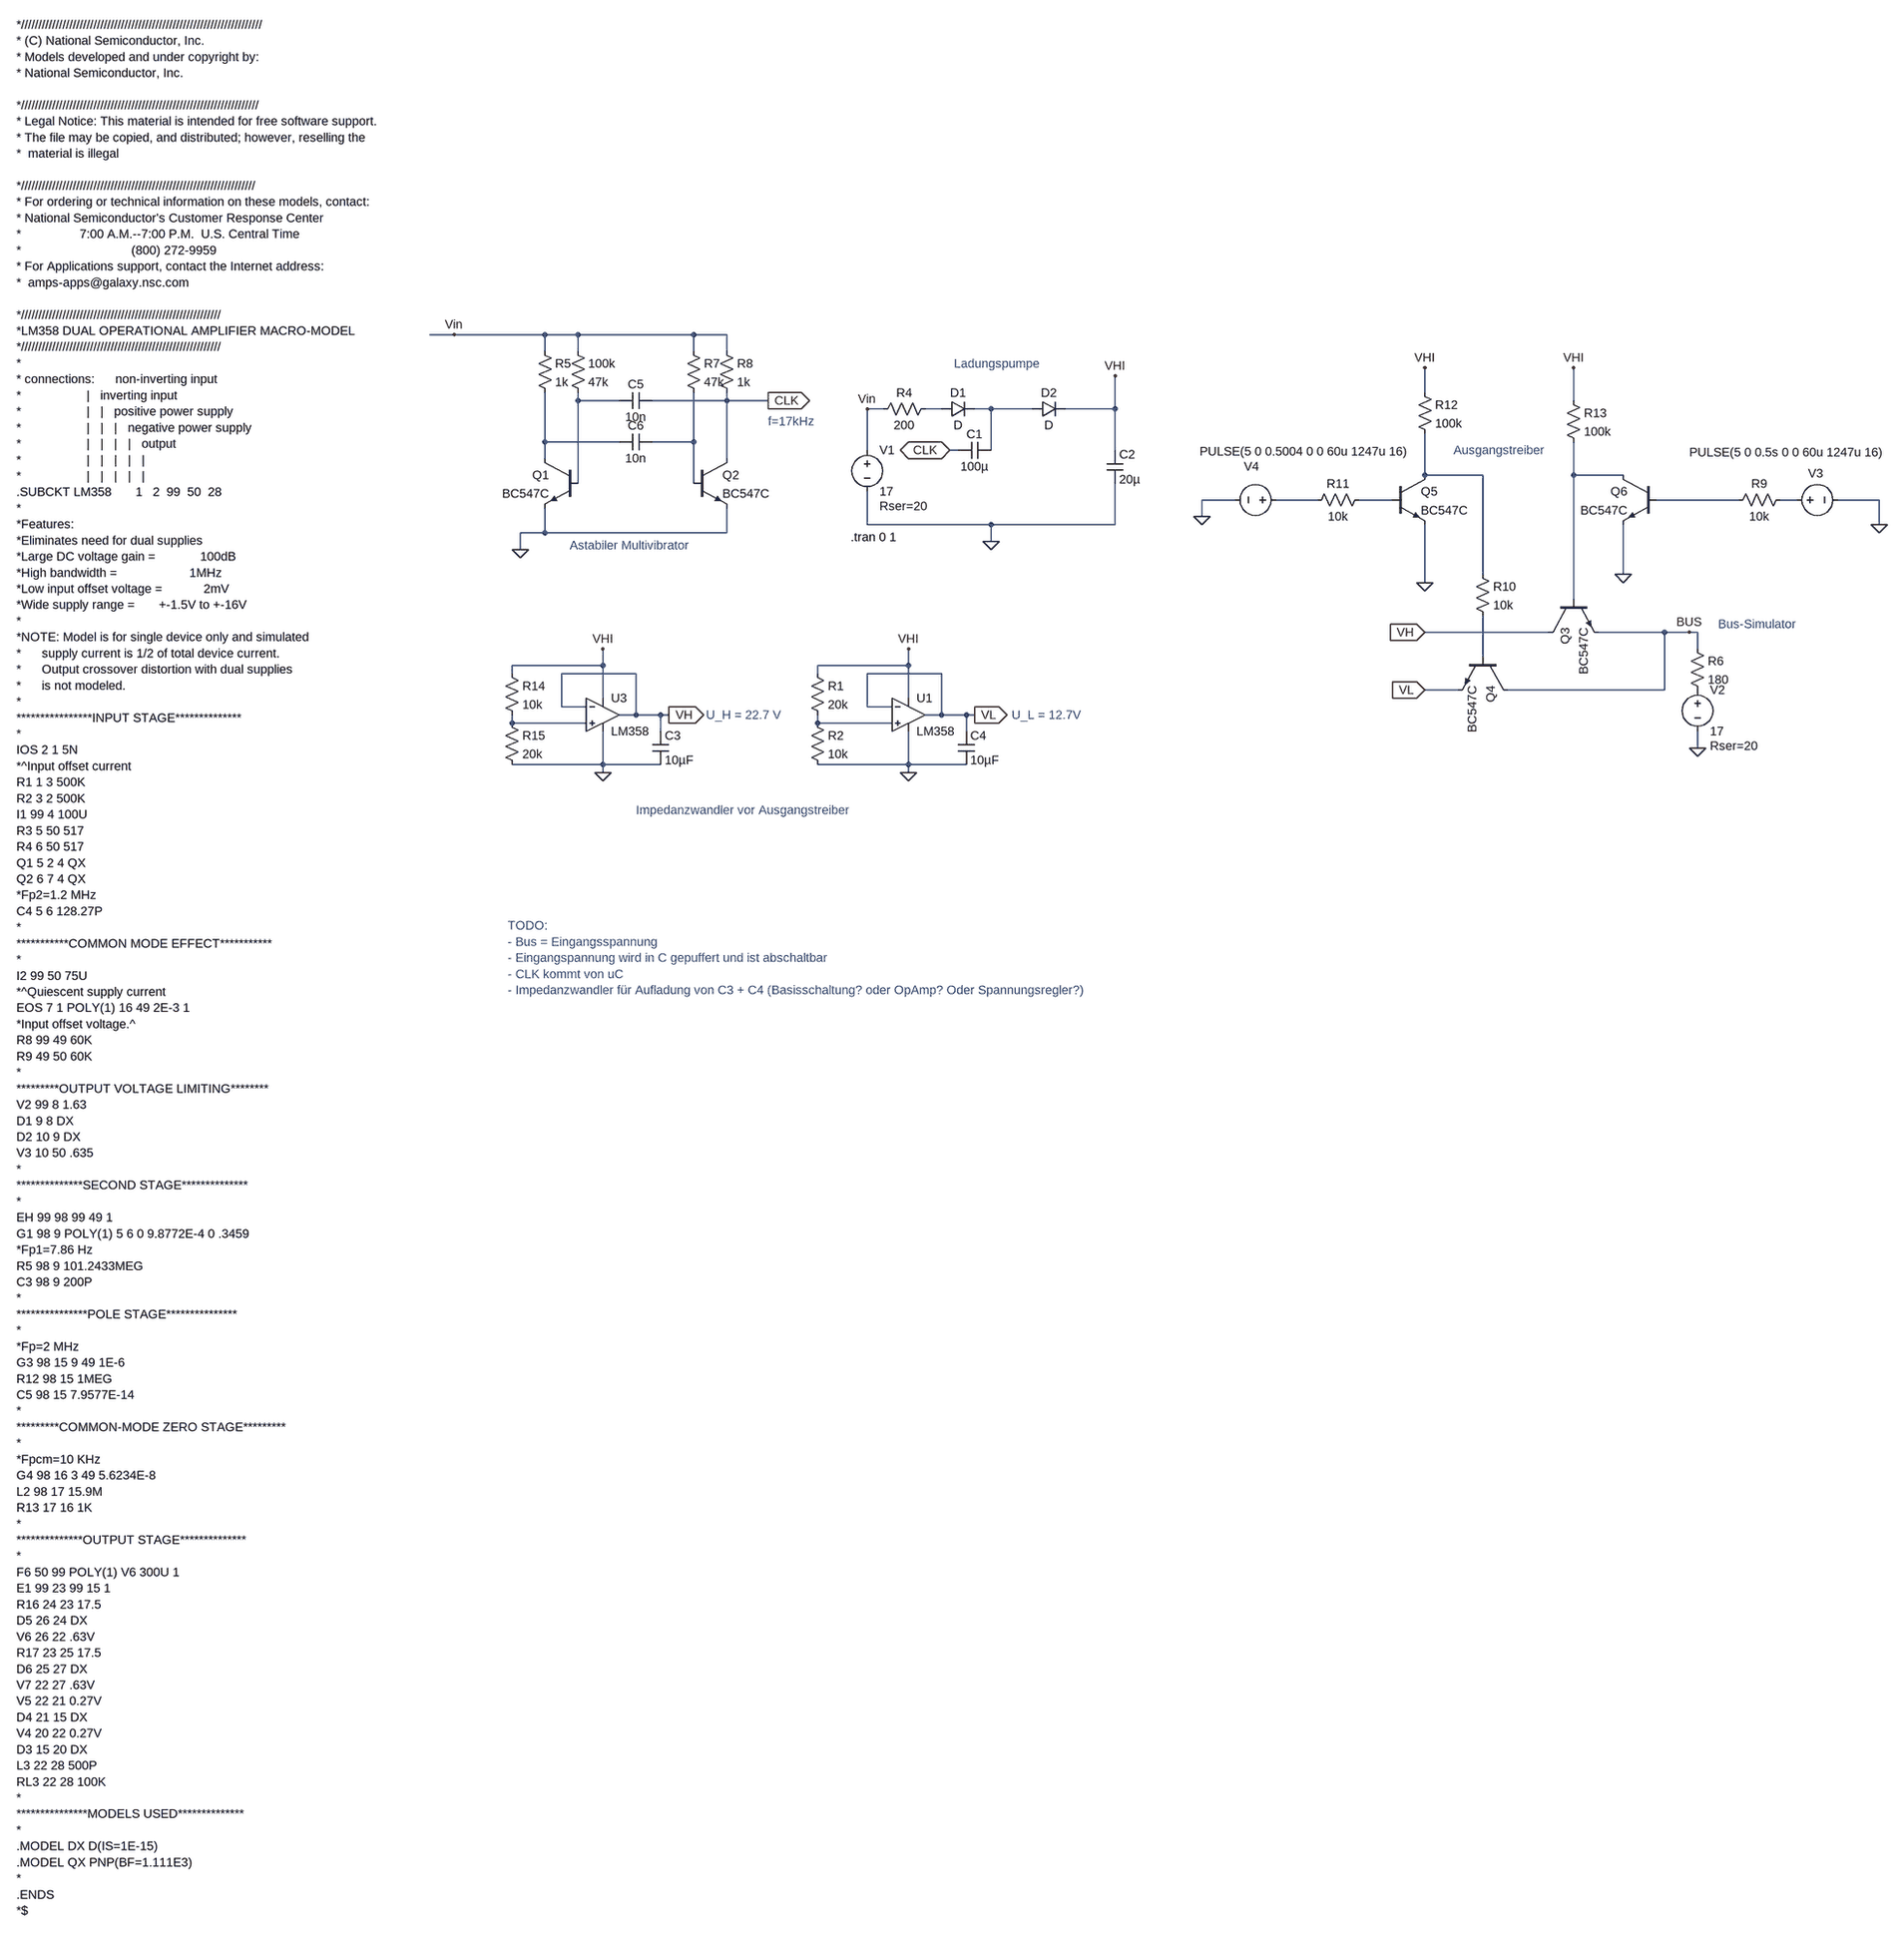
[diagram p0: schematic DriverC1.asc]
DriverC1.asc, the LTspice schematic file:
Version 4
SHEET 1 2516 2612
WIRE -768 -80 -816 -80
WIRE -592 -80 -768 -80
WIRE -528 -80 -592 -80
WIRE -304 -80 -528 -80
WIRE -240 -80 -304 -80
WIRE -592 -48 -592 -80
WIRE -528 -48 -528 -80
WIRE -304 -48 -304 -80
WIRE -240 -48 -240 -80
WIRE 1232 32 1232 -16
WIRE -528 48 -528 32
WIRE -448 48 -528 48
WIRE -240 48 -240 32
WIRE -240 48 -384 48
WIRE -160 48 -240 48
WIRE 1520 48 1520 -16
WIRE 64 64 32 64
WIRE 176 64 144 64
WIRE 272 64 240 64
WIRE 352 64 272 64
WIRE 512 64 512 0
WIRE 512 64 416 64
WIRE -592 128 -592 32
WIRE -448 128 -592 128
WIRE -304 128 -304 32
WIRE -304 128 -384 128
WIRE 32 144 32 64
WIRE 208 144 192 144
WIRE 272 144 272 64
WIRE 512 144 512 64
WIRE -592 160 -592 128
WIRE -240 160 -240 48
WIRE 1232 192 1232 112
WIRE 1344 192 1232 192
WIRE 1520 192 1520 128
WIRE 1616 192 1520 192
WIRE -528 208 -528 48
WIRE -304 208 -304 128
WIRE 864 240 800 240
WIRE 1024 240 944 240
WIRE 1168 240 1104 240
WIRE 1840 240 1680 240
WIRE 1952 240 1920 240
WIRE 2112 240 2032 240
WIRE 800 272 800 240
WIRE 32 288 32 224
WIRE 272 288 32 288
WIRE 512 288 512 208
WIRE 512 288 272 288
WIRE 2112 288 2112 240
WIRE -592 304 -592 256
WIRE -592 304 -640 304
WIRE -240 304 -240 256
WIRE -240 304 -592 304
WIRE 272 320 272 288
WIRE -640 336 -640 304
WIRE 1344 384 1344 192
WIRE 1616 384 1616 288
WIRE 1232 400 1232 288
WIRE 1520 432 1520 192
WIRE 1472 496 1232 496
WIRE 1696 496 1568 496
WIRE 1744 496 1696 496
WIRE 1760 496 1744 496
WIRE 1760 528 1760 496
WIRE 1344 544 1344 464
WIRE -480 560 -480 528
WIRE -480 560 -656 560
WIRE 112 560 112 528
WIRE 112 560 -64 560
WIRE -656 576 -656 560
WIRE -416 576 -560 576
WIRE -64 576 -64 560
WIRE 176 576 32 576
WIRE 1296 608 1232 608
WIRE 1696 608 1696 496
WIRE 1696 608 1392 608
WIRE -480 624 -480 560
WIRE 112 624 112 560
WIRE -560 640 -560 576
WIRE -512 640 -560 640
WIRE 32 640 32 576
WIRE 80 640 32 640
WIRE -416 656 -416 576
WIRE -416 656 -448 656
WIRE -368 656 -416 656
WIRE -352 656 -368 656
WIRE 176 656 176 576
WIRE 176 656 144 656
WIRE 224 656 176 656
WIRE 240 656 224 656
WIRE -656 672 -656 656
WIRE -512 672 -656 672
WIRE -64 672 -64 656
WIRE 80 672 -64 672
WIRE -368 688 -368 656
WIRE 224 688 224 656
WIRE 1760 720 1760 688
WIRE -480 752 -480 688
WIRE -480 752 -656 752
WIRE -368 752 -480 752
WIRE 112 752 112 688
WIRE 112 752 -64 752
WIRE 224 752 112 752
WIRE -480 768 -480 752
WIRE 112 768 112 752
FLAG 272 320 0
FLAG 192 144 CLK
IOPIN 192 144 BiDir
FLAG -640 336 0
FLAG -768 -80 Vin
FLAG 32 64 Vin
FLAG -160 48 CLK
IOPIN -160 48 Out
FLAG 512 0 VHI
FLAG 1760 720 0
FLAG 2112 288 0
FLAG 1744 496 BUS
FLAG 1232 608 VL
IOPIN 1232 608 In
FLAG 1232 496 VH
IOPIN 1232 496 In
FLAG 1232 -16 VHI
FLAG 800 272 0
FLAG 1232 400 0
FLAG 1520 -16 VHI
FLAG 1616 384 0
FLAG -352 656 VH
IOPIN -352 656 Out
FLAG -480 528 VHI
FLAG -480 768 0
FLAG 240 656 VL
IOPIN 240 656 Out
FLAG 112 528 VHI
FLAG 112 768 0
SYMBOL voltage 32 128 R0
WINDOW 123 0 0 Left 0
WINDOW 39 24 124 Left 2
SYMATTR SpiceLine Rser=20
SYMATTR InstName V1
SYMATTR Value 17
SYMBOL diode 176 80 R270
WINDOW 0 32 32 VTop 2
WINDOW 3 0 32 VBottom 2
SYMATTR InstName D1
SYMBOL diode 352 80 R270
WINDOW 0 32 32 VTop 2
WINDOW 3 0 32 VBottom 2
SYMATTR InstName D2
SYMBOL cap 272 128 R90
WINDOW 0 0 32 VBottom 2
WINDOW 3 32 32 VTop 2
SYMATTR InstName C1
SYMATTR Value 100µ
SYMBOL cap 496 144 R0
SYMATTR InstName C2
SYMATTR Value 20µ
SYMBOL res 160 48 R90
WINDOW 0 0 56 VBottom 2
WINDOW 3 32 56 VTop 2
SYMATTR InstName R4
SYMATTR Value 200
SYMBOL res -608 -64 R0
SYMATTR InstName R5
SYMATTR Value 1k
SYMBOL res -256 -64 R0
SYMATTR InstName R8
SYMATTR Value 1k
SYMBOL npn -528 160 M0
SYMATTR InstName Q1
SYMATTR Value BC547C
SYMBOL npn -304 160 R0
SYMATTR InstName Q2
SYMATTR Value BC547C
SYMBOL res -544 -64 R0
SYMATTR InstName 100k
SYMATTR Value 47k
SYMBOL res -320 -64 R0
SYMATTR InstName R7
SYMATTR Value 47k
SYMBOL cap -384 32 R90
WINDOW 0 0 32 VBottom 2
WINDOW 3 32 32 VTop 2
SYMATTR InstName C5
SYMATTR Value 10n
SYMBOL cap -384 112 R90
WINDOW 0 0 32 VBottom 2
WINDOW 3 32 32 VTop 2
SYMATTR InstName C6
SYMATTR Value 10n
SYMBOL voltage 1760 592 R0
WINDOW 123 0 0 Left 0
WINDOW 39 24 124 Left 2
SYMATTR SpiceLine Rser=20
SYMATTR InstName V2
SYMATTR Value 17
SYMBOL res 1744 512 R0
SYMATTR InstName R6
SYMATTR Value 180
SYMBOL voltage 1936 240 M90
WINDOW 0 -51 68 VLeft 2
WINDOW 3 -92 185 VLeft 2
WINDOW 123 0 0 Left 0
WINDOW 39 0 0 Left 0
SYMATTR InstName V3
SYMATTR Value PULSE(5 0 0.5s 0 0 60u 1247u 16)
SYMBOL npn 1472 432 M90
SYMATTR InstName Q3
SYMATTR Value BC547C
SYMBOL res 1936 224 R90
WINDOW 0 0 56 VBottom 2
WINDOW 3 32 56 VTop 2
SYMATTR InstName R9
SYMATTR Value 10k
SYMBOL voltage 960 240 M270
WINDOW 0 65 78 VLeft 2
WINDOW 3 94 164 VLeft 2
WINDOW 123 0 0 Left 0
WINDOW 39 0 0 Left 0
SYMATTR InstName V4
SYMATTR Value PULSE(5 0 0.5004 0 0 60u 1247u 16)
SYMBOL res 1328 368 R0
SYMATTR InstName R10
SYMATTR Value 10k
SYMBOL npn 1392 544 R90
SYMATTR InstName Q4
SYMATTR Value BC547C
SYMBOL npn 1168 192 R0
SYMATTR InstName Q5
SYMATTR Value BC547C
SYMBOL res 1120 224 R90
WINDOW 0 0 56 VBottom 2
WINDOW 3 32 56 VTop 2
SYMATTR InstName R11
SYMATTR Value 10k
SYMBOL res 1216 16 R0
SYMATTR InstName R12
SYMATTR Value 100k
SYMBOL npn 1680 192 M0
SYMATTR InstName Q6
SYMATTR Value BC547C
SYMBOL res 1504 32 R0
SYMATTR InstName R13
SYMATTR Value 100k
SYMBOL Opamps\\opamp2 -480 592 R0
SYMATTR InstName U3
SYMATTR Value LM358
SYMATTR SpiceModel LM358
SYMBOL res -672 560 R0
SYMATTR InstName R14
SYMATTR Value 10k
SYMBOL res -672 656 R0
SYMATTR InstName R15
SYMATTR Value 20k
SYMBOL cap -384 688 R0
SYMATTR InstName C3
SYMATTR Value 10µF
SYMBOL Opamps\\opamp2 112 592 R0
SYMATTR InstName U1
SYMATTR Value LM358
SYMATTR SpiceModel LM358
SYMBOL res -80 560 R0
SYMATTR InstName R1
SYMATTR Value 20k
SYMBOL res -80 656 R0
SYMATTR InstName R2
SYMATTR Value 10k
SYMBOL cap 208 688 R0
SYMATTR InstName C4
SYMATTR Value 10µF
TEXT 0 312 Left 2 !.tran 0 1
TEXT -544 328 Left 2 ;Astabiler Multivibrator
TEXT 200 -24 Left 2 ;Ladungspumpe
TEXT -160 88 Left 2 ;f=17kHz
TEXT 1800 480 Left 2 ;Bus-Simulator
TEXT 1288 144 Left 2 ;Ausgangstreiber
TEXT -664 1064 Left 2 ;TODO: \n- Bus = Eingangsspannung\n- Eingangspannung wird in C gepuffert und ist abschaltbar\n- CLK kommt von uC\n- Impedanzwandler für Aufladung von C3 + C4 (Basisschaltung? oder OpAmp? Oder Spannungsregler?)
TEXT -2704 -680 Left 2 !*//////////////////////////////////////////////////////////////////////\n* (C) National Semiconductor, Inc.\n* Models developed and under copyright by:\n* National Semiconductor, Inc.  \n \n*/////////////////////////////////////////////////////////////////////\n* Legal Notice: This material is intended for free software support.\n* The file may be copied, and distributed; however, reselling the \n*  material is illegal\n \n*////////////////////////////////////////////////////////////////////\n* For ordering or technical information on these models, contact:\n* National Semiconductor's Customer Response Center\n*                 7:00 A.M.--7:00 P.M.  U.S. Central Time\n*                                (800) 272-9959\n* For Applications support, contact the Internet address:\n*  amps-apps@galaxy.nsc.com\n \n*//////////////////////////////////////////////////////////\n*LM358 DUAL OPERATIONAL AMPLIFIER MACRO-MODEL\n*//////////////////////////////////////////////////////////\n*\n* connections:      non-inverting input\n*                   |   inverting input\n*                   |   |   positive power supply\n*                   |   |   |   negative power supply\n*                   |   |   |   |   output\n*                   |   |   |   |   |\n*                   |   |   |   |   |\n.SUBCKT LM358       1   2  99  50  28\n*\n*Features:\n*Eliminates need for dual supplies\n*Large DC voltage gain =             100dB\n*High bandwidth =                     1MHz\n*Low input offset voltage =            2mV\n*Wide supply range =       +-1.5V to +-16V\n*\n*NOTE: Model is for single device only and simulated\n*      supply current is 1/2 of total device current.\n*      Output crossover distortion with dual supplies\n*      is not modeled.\n*\n****************INPUT STAGE**************\n*\nIOS 2 1 5N\n*^Input offset current\nR1 1 3 500K\nR2 3 2 500K\nI1 99 4 100U\nR3 5 50 517\nR4 6 50 517\nQ1 5 2 4 QX\nQ2 6 7 4 QX\n*Fp2=1.2 MHz\nC4 5 6 128.27P\n*\n***********COMMON MODE EFFECT***********\n*\nI2 99 50 75U\n*^Quiescent supply current\nEOS 7 1 POLY(1) 16 49 2E-3 1\n*Input offset voltage.^\nR8 99 49 60K\nR9 49 50 60K\n*\n*********OUTPUT VOLTAGE LIMITING********\nV2 99 8 1.63\nD1 9 8 DX\nD2 10 9 DX\nV3 10 50 .635\n*\n**************SECOND STAGE**************\n*\nEH 99 98 99 49 1\nG1 98 9 POLY(1) 5 6 0 9.8772E-4 0 .3459\n*Fp1=7.86 Hz\nR5 98 9 101.2433MEG\nC3 98 9 200P\n*\n***************POLE STAGE***************\n*\n*Fp=2 MHz\nG3 98 15 9 49 1E-6\nR12 98 15 1MEG\nC5 98 15 7.9577E-14\n*\n*********COMMON-MODE ZERO STAGE*********\n*\n*Fpcm=10 KHz\nG4 98 16 3 49 5.6234E-8               \nL2 98 17 15.9M\nR13 17 16 1K\n*\n**************OUTPUT STAGE**************\n*\nF6 50 99 POLY(1) V6 300U 1\nE1 99 23 99 15 1\nR16 24 23 17.5\nD5 26 24 DX\nV6 26 22 .63V\nR17 23 25 17.5\nD6 25 27 DX\nV7 22 27 .63V\nV5 22 21 0.27V\nD4 21 15 DX\nV4 20 22 0.27V\nD3 15 20 DX\nL3 22 28 500P\nRL3 22 28 100K\n*\n***************MODELS USED**************\n*\n.MODEL DX D(IS=1E-15)\n.MODEL QX PNP(BF=1.111E3)\n*\n.ENDS\n*$
TEXT -280 656 Left 2 ;U_H = 22.7 V
TEXT 312 656 Left 2 ;U_L = 12.7V
TEXT -416 840 Left 2 ;Impedanzwandler vor Ausgangstreiber

The netlist it stands for:
* DriverC1.asc
V1 Vin 0 17 Rser=20
D1 N002 N003 D
D2 N003 VHI D
C1 N003 CLK 100µ
C2 VHI 0 20µ
R4 N002 Vin 200
R5 Vin N004 1k
R8 Vin CLK 1k
Q1 N004 N001 0 0 BC547C
Q2 CLK N005 0 0 BC547C
R§100k Vin N001 47k
R7 Vin N005 47k
C5 CLK N001 10n
C6 N005 N004 10n
V2 P001 0 17 Rser=20
R6 BUS P001 180
V3 N011 0 PULSE(5 0 0.5s 0 0 60u 1247u 16)
Q3 VH N007 BUS 0 BC547C
R9 N011 N010 10k
V4 N008 0 PULSE(5 0 0.5004 0 0 60u 1247u 16)
R10 N006 N012 10k
Q4 BUS N012 VL 0 BC547C
Q5 N006 N009 0 0 BC547C
R11 N009 N008 10k
R12 VHI N006 100k
Q6 N007 N010 0 0 BC547C
R13 VHI N007 100k
XU3 N013 VH VHI 0 VH LM358 LM358  ; pins In+ In- V+ V- OUT
R14 VHI N013 10k
R15 N013 0 20k
C3 VH 0 10µF
XU1 N014 VL VHI 0 VL LM358 LM358  ; pins In+ In- V+ V- OUT
R1 VHI N014 20k
R2 N014 0 10k
C4 VL 0 10µF
.model D D
.lib standard.dio
.model NPN NPN
.model PNP PNP
.lib standard.bjt
.tran 0 1
* Astabiler Multivibrator
* Ladungspumpe
* f=17kHz
* Bus-Simulator
* Ausgangstreiber
* TODO:
* - Bus = Eingangsspannung
* - Eingangspannung wird in C gepuffert und ist abschaltbar
* - CLK kommt von uC
* - Impedanzwandler für Aufladung von C3 + C4 (Basisschaltung? oder OpAmp? Oder Spannungsregler?)
*//////////////////////////////////////////////////////////////////////
* (C) National Semiconductor, Inc.
* Models developed and under copyright by:
* National Semiconductor, Inc.
*/////////////////////////////////////////////////////////////////////
* Legal Notice: This material is intended for free software support.
* The file may be copied, and distributed; however, reselling the
*  material is illegal
*////////////////////////////////////////////////////////////////////
* For ordering or technical information on these models, contact:
* National Semiconductor's Customer Response Center
*                 7:00 A.M.--7:00 P.M.  U.S. Central Time
*                                (800) 272-9959
* For Applications support, contact the Internet address:
*  amps-apps@galaxy.nsc.com
*//////////////////////////////////////////////////////////
*LM358 DUAL OPERATIONAL AMPLIFIER MACRO-MODEL
*//////////////////////////////////////////////////////////
*
* connections:      non-inverting input
*                   |   inverting input
*                   |   |   positive power supply
*                   |   |   |   negative power supply
*                   |   |   |   |   output
*                   |   |   |   |   |
*                   |   |   |   |   |
.SUBCKT LM358       1   2  99  50  28
*
*Features:
*Eliminates need for dual supplies
*Large DC voltage gain =             100dB
*High bandwidth =                     1MHz
*Low input offset voltage =            2mV
*Wide supply range =       +-1.5V to +-16V
*
*NOTE: Model is for single device only and simulated
*      supply current is 1/2 of total device current.
*      Output crossover distortion with dual supplies
*      is not modeled.
*
****************INPUT STAGE**************
*
IOS 2 1 5N
*^Input offset current
R1 1 3 500K
R2 3 2 500K
I1 99 4 100U
R3 5 50 517
R4 6 50 517
Q1 5 2 4 QX
Q2 6 7 4 QX
*Fp2=1.2 MHz
C4 5 6 128.27P
*
***********COMMON MODE EFFECT***********
*
I2 99 50 75U
*^Quiescent supply current
EOS 7 1 POLY(1) 16 49 2E-3 1
*Input offset voltage.^
R8 99 49 60K
R9 49 50 60K
*
*********OUTPUT VOLTAGE LIMITING********
V2 99 8 1.63
D1 9 8 DX
D2 10 9 DX
V3 10 50 .635
*
**************SECOND STAGE**************
*
EH 99 98 99 49 1
G1 98 9 POLY(1) 5 6 0 9.8772E-4 0 .3459
*Fp1=7.86 Hz
R5 98 9 101.2433MEG
C3 98 9 200P
*
***************POLE STAGE***************
*
*Fp=2 MHz
G3 98 15 9 49 1E-6
R12 98 15 1MEG
C5 98 15 7.9577E-14
*
*********COMMON-MODE ZERO STAGE*********
*
*Fpcm=10 KHz
G4 98 16 3 49 5.6234E-8
L2 98 17 15.9M
R13 17 16 1K
*
**************OUTPUT STAGE**************
*
F6 50 99 POLY(1) V6 300U 1
E1 99 23 99 15 1
R16 24 23 17.5
D5 26 24 DX
V6 26 22 .63V
R17 23 25 17.5
D6 25 27 DX
V7 22 27 .63V
V5 22 21 0.27V
D4 21 15 DX
V4 20 22 0.27V
D3 15 20 DX
L3 22 28 500P
RL3 22 28 100K
*
***************MODELS USED**************
*
.MODEL DX D(IS=1E-15)
.MODEL QX PNP(BF=1.111E3)
*
.ENDS
*$
* U_H = 22.7 V
* U_L = 12.7V
* Impedanzwandler vor Ausgangstreiber
.backanno
.end